# Altium schematic sheet Battery_Charging.SchDoc: Battery Charging
size A4; DocumentNumber: 9; SheetNumber: 14; SheetTotal: 18
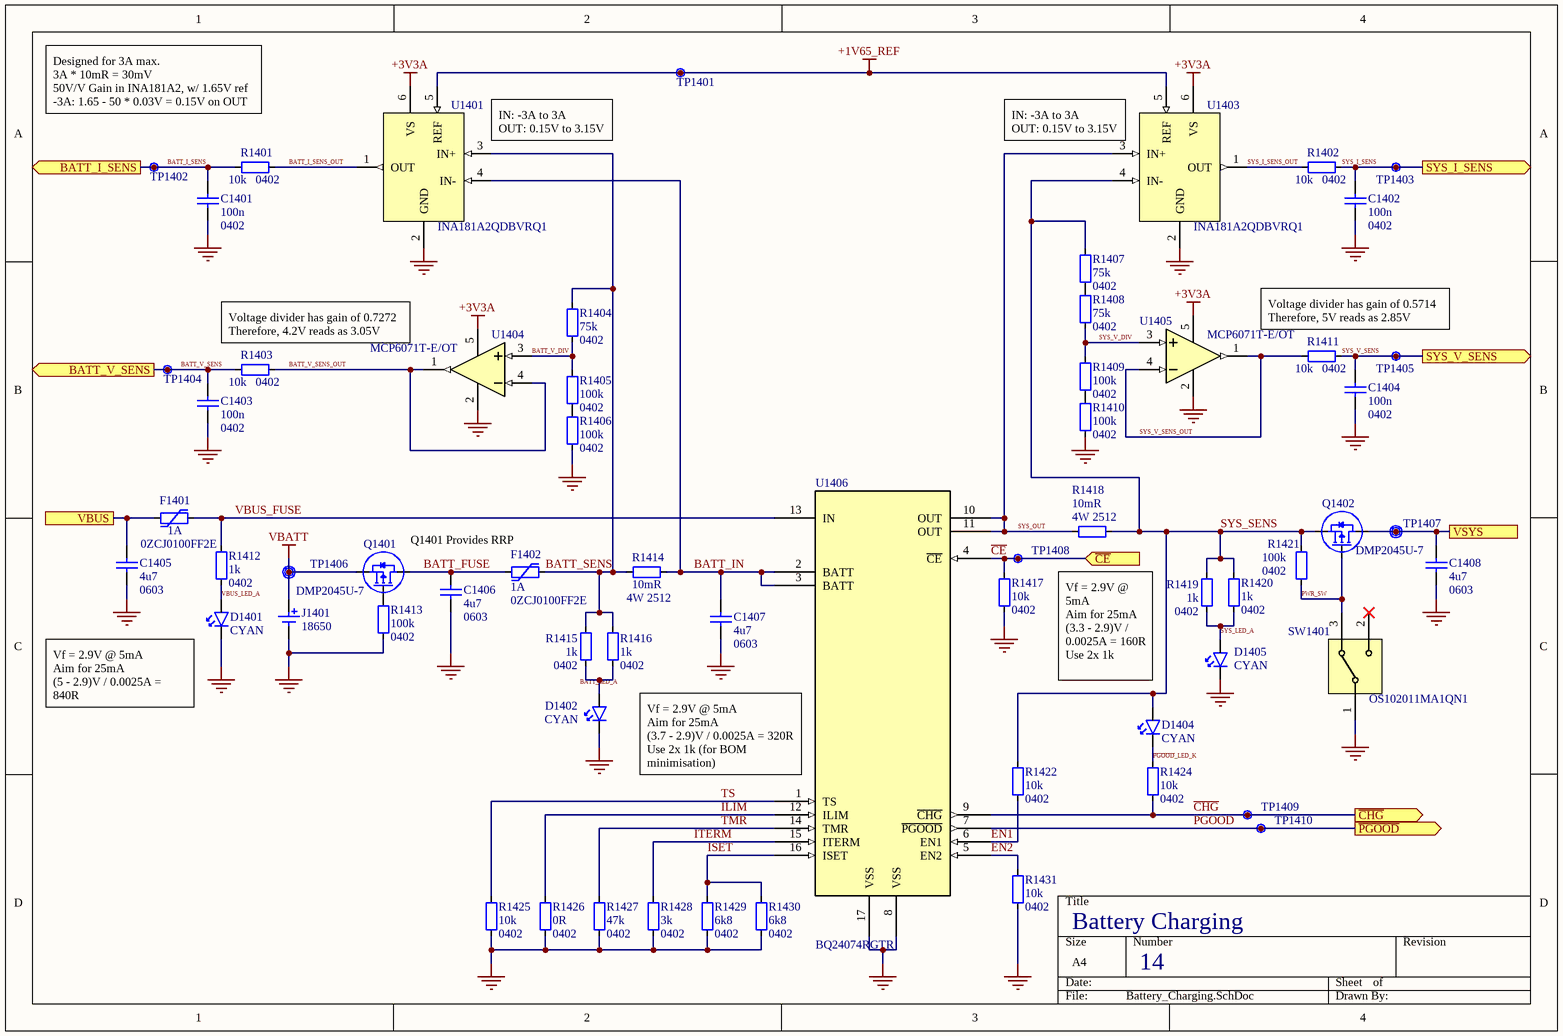
[diagram p0: Battery_Charging.SchDoc]

## Parts
C1401  100n  Footprint: 0402  [CAP_0402_B]
C1402  100n  Footprint: 0402  [CAP_0402_B]
C1403  100n  Footprint: 0402  [CAP_0402_B]
C1404  100n  Footprint: 0402  [CAP_0402_B]
C1405  4u7  Footprint: 0603  [CAP_0603_B]
C1406  4u7  Footprint: 0603  [CAP_0603_B]
C1407  4u7  Footprint: 0603  [CAP_0603_B]
C1408  4u7  Footprint: 0603  [CAP_0603_B]
D1401  CYAN  [SMLD12E3N1WT86]
D1402  CYAN  [SMLD12E3N1WT86]
D1404  CYAN  [SMLD12E3N1WT86]
D1405  CYAN  [SMLD12E3N1WT86]
F1401  1A  [0ZCJ0100FF2E]
F1402  1A  [0ZCJ0100FF2E]
J1401  18650  [1042P]
Q1401  DMP2045U-7  [DMP2045U-7]
Q1402  DMP2045U-7  [DMP2045U-7]
R1401  10k  Footprint: 0402  [RES_0402_A]
R1402  10k  Footprint: 0402  [RES_0402_A]
R1403  10k  Footprint: 0402  [RES_0402_A]
R1404  75k  Footprint: 0402  [RES_0402_A]
R1405  100k  Footprint: 0402  [RES_0402_A]
R1406  100k  Footprint: 0402  [RES_0402_A]
R1407  75k  Footprint: 0402  [RES_0402_A]
R1408  75k  Footprint: 0402  [RES_0402_A]
R1409  100k  Footprint: 0402  [RES_0402_A]
R1410  100k  Footprint: 0402  [RES_0402_A]
R1411  10k  Footprint: 0402  [RES_0402_A]
R1412  1k  Footprint: 0402  [RES_0402_A]
R1413  100k  Footprint: 0402  [RES_0402_A]
R1414  10mR  Footprint: 2512  Power: 4W  [VMS-R010-1.0-U]
R1415  1k  Footprint: 0402  [RES_0402_A]
R1416  1k  Footprint: 0402  [RES_0402_A]
R1417  10k  Footprint: 0402  [RES_0402_A]
R1418  10mR  Footprint: 2512  Power: 4W  [VMS-R010-1.0-U]
R1419  1k  Footprint: 0402  [RES_0402_A]
R1420  1k  Footprint: 0402  [RES_0402_A]
R1421  100k  Footprint: 0402  [RES_0402_A]
R1422  10k  Footprint: 0402  [RES_0402_A]
R1424  10k  Footprint: 0402  [RES_0402_A]
R1425  10k  Footprint: 0402  [RES_0402_A]
R1426  0R  Footprint: 0402  [RES_0402_A]
R1427  47k  Footprint: 0402  [RES_0402_A]
R1428  3k  Footprint: 0402  [RES_0402_A]
R1429  6k8  Footprint: 0402  [RES_0402_A]
R1430  6k8  Footprint: 0402  [RES_0402_A]
R1431  10k  Footprint: 0402  [RES_0402_A]
SW1401  OS102011MA1QN1  [OS102011MA1QN1]
TP1401  Net  [Unlabelled Testpoint]  (value not drawn)
TP1402  Net  [Unlabelled Testpoint]  (value not drawn)
TP1403  Net  [Unlabelled Testpoint]  (value not drawn)
TP1404  Net  [Unlabelled Testpoint]  (value not drawn)
TP1405  Net  [Unlabelled Testpoint]  (value not drawn)
TP1406  Net  [Labelled Testpoint]  (value not drawn)
TP1407  Net  [Labelled Testpoint]  (value not drawn)
TP1408  Net  [Unlabelled Testpoint]  (value not drawn)
TP1409  Net  [Unlabelled Testpoint]  (value not drawn)
TP1410  Net  [Unlabelled Testpoint]  (value not drawn)
U1401  INA181A2QDBVRQ1  [INA181A2QDBVRQ1]
U1403  INA181A2QDBVRQ1  [INA181A2QDBVRQ1]
U1404  MCP6071T-E/OT  [MCP6071T-E/OT]
U1405  MCP6071T-E/OT  [MCP6071T-E/OT]
U1406  BQ24074RGTR  [BQ24074RGTR]

## Ports
BATT_I_SENS (out, see Top_Level[4A], Power_Sense[1A]), BATT_V_SENS (out, see Top_Level[4A], Power_Sense[1A]), SYS_I_SENS (out, see Top_Level[4A], Power_Sense[1A]), SYS_V_SENS (out, see Top_Level[4A], Power_Sense[1A]), VBUS (see Top_Level[4A], USB[4A]), VSYS (see Top_Level[4A], 3V3_Regulators[1A], 5V_Regulator[1B]), ~{CE} (in, see Top_Level[4A], Power_Sense[1B]), ~{CHG} (out, see Top_Level[4A], Power_Sense[1A]), ~{PGOOD} (out, see Top_Level[4A], Power_Sense[1A])

## Nets
+1V65_REF: TP1401.1 U1401.5(REF) U1403.5(REF)
+3V3A: U1401.6(VS) U1403.6(VS) U1404.5(VDD) U1405.5(VDD)
GND: C1401.2 C1402.2 C1403.2 C1404.2 C1405.2 C1406.2 C1407.2 C1408.2 D1401.2 D1402.2 D1405.2 J1401.2 R1406.2(a) R1410.2(a) R1413.2(a) R1417.2(a) R1425.2(a) R1426.2(a) R1427.2(a) R1428.2(a) R1429.2(a) R1430.2(a) R1431.2(a) SW1401.1 U1401.2(GND) U1403.2(GND) U1404.2(VSS) U1405.2(VSS) U1406.8(VSS) U1406.17(VSS)
VBATT: J1401.1 Q1401.2(S) TP1406.1
~{PGOOD}_LED_K: D1404.2 R1424.1(a)
BATT_FUSE: C1406.1 F1402.1(a) Q1401.3(D)
BATT_I_SENS: C1401.1 R1401.1(a) TP1402.1 ; port BATT_I_SENS
BATT_I_SENS_OUT: R1401.2(a) U1401.1(OUT)
BATT_IN: C1407.1 R1414.2(a) U1401.4(IN-) U1406.2(BATT) U1406.3(BATT)
BATT_LED_A: D1402.1 R1415.2(a) R1416.2(a)
BATT_SENS: F1402.2(a) R1404.1(a) R1414.1(a) R1415.1(a) R1416.1(a) U1401.3(IN+)
BATT_V_DIV: R1404.2(a) R1405.1(a) U1404.3(VIN+)
BATT_V_SENS: C1403.1 R1403.1(a) TP1404.1 ; port BATT_V_SENS
BATT_V_SENS_OUT: R1403.2(a) U1404.1(VOUT) U1404.4(VIN-)
~{CE}: R1417.1(a) TP1408.1 U1406.4(~{CE}) ; port ~{CE}
~{CHG}: R1424.2(a) TP1409.1 U1406.9(~{CHG}) ; port ~{CHG}
EN1: R1422.2(a) U1406.6(EN1)
EN2: R1431.1(a) U1406.5(EN2)
ILIM: R1426.1(a) U1406.12(ILIM)
ISET: R1429.1(a) R1430.1(a) U1406.16(ISET)
ITERM: R1428.1(a) U1406.15(ITERM)
~{PGOOD}: TP1410.1 U1406.7(~{PGOOD}) ; port ~{PGOOD}
PWR_SW: Q1402.1(G) R1421.2(a) SW1401.3
SYS_I_SENS: C1402.1 R1402.2(a) TP1403.1 ; port SYS_I_SENS
SYS_I_SENS_OUT: R1402.1(a) U1403.1(OUT)
SYS_LED_A: D1405.1 R1419.2(a) R1420.2(a)
SYS_OUT: R1418.1(a) U1403.3(IN+) U1406.10(OUT) U1406.11(OUT)
SYS_SENS: D1404.1 Q1402.2(S) R1407.2(a) R1418.2(a) R1419.1(a) R1420.1(a) R1421.1(a) R1422.1(a) U1403.4(IN-)
SYS_V_DIV: R1408.1(a) R1409.1(a) U1405.3(VIN+)
SYS_V_SENS: C1404.1 R1411.2(a) TP1405.1 ; port SYS_V_SENS
SYS_V_SENS_OUT: R1411.1(a) U1405.1(VOUT) U1405.4(VIN-)
TMR: R1427.1(a) U1406.14(TMR)
TS: R1425.1(a) U1406.1(TS)
VBUS: C1405.1 F1401.1(a) ; port VBUS
VBUS_FUSE: F1401.2(a) R1412.1(a) U1406.13(IN)
VBUS_LED_A: D1401.1 R1412.2(a)
VSYS: C1408.1 Q1402.3(D) TP1407.1 ; port VSYS
NetQ1401_1: Q1401.1(G) R1413.1(a)
NetR1405_2: R1405.2(a) R1406.1(a)
NetR1407_1: R1407.1(a) R1408.2(a)
NetR1409_2: R1409.2(a) R1410.1(a)

Not connected (* = marked no-connect by the designer): SW1401 2(0)*

## Notes on the sheet
- Designed for 3A max.
  3A * 10mR = 30mV
  50V/V Gain in INA181A2, w/ 1.65V ref
  -3A: 1.65 - 50 * 0.03V = 0.15V on OUT
  0A -> 1.65V on OUT
  3A: 1.65 + 50 * 0.03V = 3.15V on OUT
- (near U1401) IN: -3A to 3A
  OUT: 0.15V to 3.15V
- (near U1403) IN: -3A to 3A
  OUT: 0.15V to 3.15V
- Voltage divider has gain of 0.7272
  Therefore, 4.2V reads as 3.05V
- Voltage divider has gain of 0.5714
  Therefore, 5V reads as 2.85V
- Q1401 Provides RRP
- (near D1401) Vf = 2.9V @ 5mA
  Aim for 25mA
  (5 - 2.9)V / 0.0025A = 840R
  Use 1k (for BOM minimisation)
- Vf = 2.9V @ 5mA
  Aim for 25mA
  (3.3 - 2.9)V / 0.0025A = 160R
  Use 2x 1k
- (near U1406) Vf = 2.9V @ 5mA
  Aim for 25mA
  (3.7 - 2.9)V / 0.0025A = 320R
  Use 2x 1k (for BOM minimisation)

## Library data of the parts
C1401-C1404 = CAP_0402: 0402 SMD Capacitor
C1405-C1408 = CAP_0603: 0603 SMD Capacitor
D1401 D1402 D1404 D1405 = LED_Generic: Part Number: SMLD12E3N1WT86; Supplier 1: DigiKey; Supplier Part Number 1: SMLD12E3N1WT86CT-ND
F1401 F1402 = FUSE_GENERIC: Generic Fuse Symbol; Part Number: 0ZCJ0100FF2E; Supplier 1: Avnet; Supplier Part Number 1: 48AC8418
J1401 = 1042P: BATTERY HOLDER 18650 SMD; Supplier 1: DigiKey; Supplier Part Number 1: 36-1042P-ND
Q1401 Q1402 = DMP2045U-7: MOSFET P-CH 20V 4.3A SOT23; Supplier 1: DigiKey; Supplier Part Number 1: DMP2045U-7DICT-ND
R1401-R1413 R1415-R1417 R1419-R1422 R1424-R1431 = RES_0402: 0402 SMD Resistor
R1414 R1418 = RES_GENERIC: VMS-R010-1.0-U; Supplier 1: DigiKey; Supplier Part Number 1: 4423-VMS-R010-1.0-UDKR-ND
SW1401 = OS102011MA1QN1: SWITCH SLIDE SPDT 100MA 12V
TP1401-TP1405 TP1408-TP1410 = Unlabelled Testpoint: Symbol for an unlabelled testpoint
TP1406 TP1407 = Labelled Testpoint: Symbol for a labelled testpoint
U1401 U1403 = INA181A2QDBVRQ1: Current Sense Amplifier 1 Circuit Rail-to-Rail SOT-23-6; Supplier 1: DigiKey; Supplier Part Number 1: 296-INA181A2QDBVRQ1CT-ND
U1404 U1405 = MCP6071T-E/OT: Standard (General Purpose) Amplifier 1 Circuit Rail-to-Rail SOT-23-5; Supplier 1: Arrow Electronics; Supplier Part Number 1: MCP6071T-E/OT
U1406 = BQ24074RGTR: Charger IC Lithium Ion 16-VQFN (3x3); Supplier 1: DigiKey; Supplier Part Number 1: 296-38873-1-ND